# EasyEDA Pro project ProPrj_omb-2024-nano_2026-02-09.epro, schematic Schematic1_2
Board Name: v3-imu-gnss-onboard; Create Date: 2024-06-08; Page Name: P1; Project Name: omb-2024-nano; Schematic Name: Schematic1_2; Update Date: 2024-06-17; Company: EasyEDA.com; Drawn: gauteh; Page Size: A4; Part Number: JLCPCB-002; Reviewed: EasyEDA; Version: V0.1
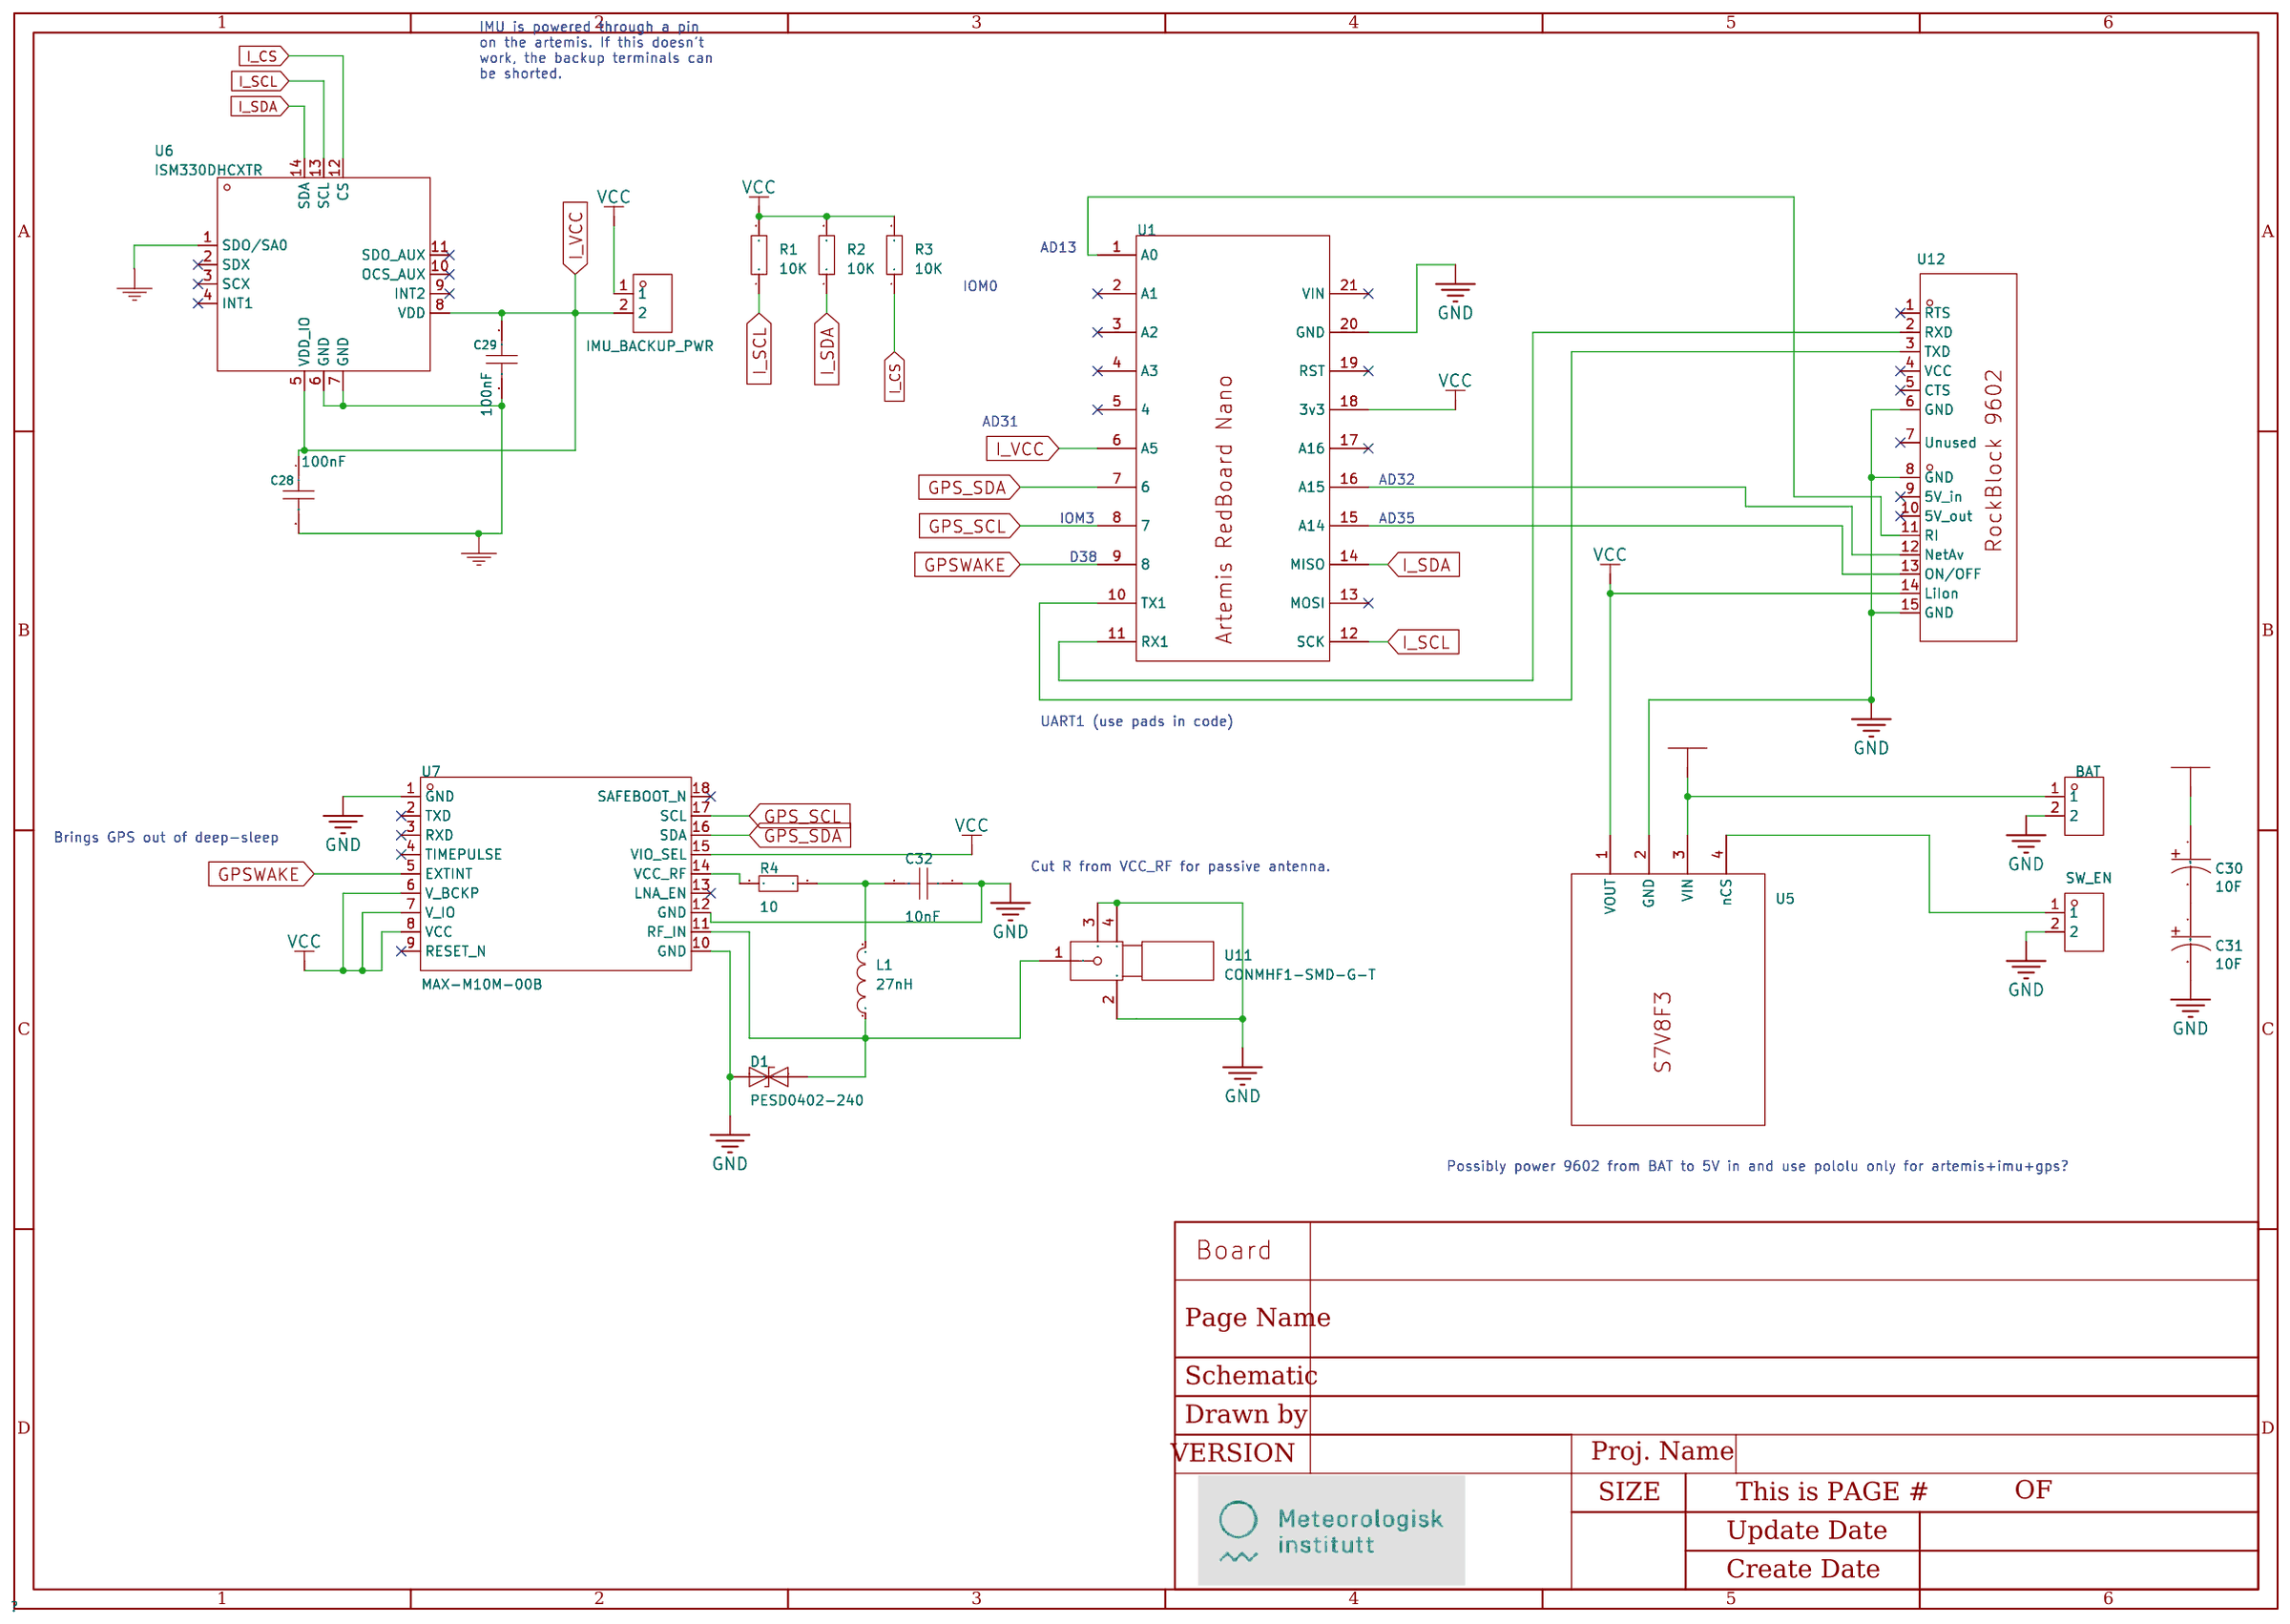
[diagram p2: schematic sheet]

## Parts
BAT1  BAT  [HDR-TH_2P-P2.54-V-M-1]  (no BOM)
C28  100nF  [C0402]
C29  100nF  [C0402]
C30  10F  [CP_12.5X20MM]  (no BOM)
C31  10F  [CP_12.5X20MM]  (no BOM)
C32  10nF  [C0603]
D1  PESD0402-240  [D0402-BI]
IMUBACKUPPWR1  IMU_BACKUP_PWR  [HDR-TH_2P-P2.54-V-M-1]  (no BOM)
L1  27nH  [L0402]
R1  10K  [R0603]
R2  10K  [R0603]
R3  10K  [R0603]
R4  10  [R0603]
SWEN1  SW_EN  [HDR-TH_2P-P2.54-V-M-1]  (no BOM)
U1  -  [ARTEMIS REDBOARD NANO]
U5  -  [HDR-F-2.54_1X4]  (no BOM)
U6  ISM330DHCXTR  [LGA-14_L3.0-W2.5-P0.50-BR]
U7  MAX-M10M-00B  [COMM-SMD_L10.1-W9.7-P1.10_GT-1110F2-AGGB]
U11  CONMHF1-SMD-G-T  [RF-SMD_CONMHF1-SMD-G-T]
U12  -  [HDR-F-2.54_1X15]

## Library data of the parts
BAT1 IMUBACKUPPWR1 SWEN1 = 22284020: Pin Structure:1x2P Pitch:2.54mm Row Spacing:- Circluar Pins/Square Pins:Square Pins Mounting Type:Straight Number of Rows:Plugin Number of Pins:2P Current Rating (Max):- Voltage Rating (Max):- Length of Mating Pin:- Insulation Height:- Contact Material: C; LCSC Part Name: 间距:2.54mm 1x2P 直插 方针; Supplier Part: C234182; Manufacturer: MOLEX; Supplier Footprint: 插件,P=2.54mm; JLCPCB Part Class: Extended Part; Datasheet: https://atta.szlcsc.com/upload/public/pdf/source/20180801/C234182_F77B1C2A9EF8AC9B34CEB7670B45930E.pdf; Supplier: LCSC; Pin Structure: 1x2P; Pitch: 2.54mm; Circluar Pins/Square Pins: Square Pins; Mounting Type: Straight; Number of Rows: Plugin; Number of Pins: 2P; Color: Black
C28 C29 = CC0402KRX7R7BB104: Capacitance: Tolerance:±10% Tolerance:±10% Voltage Rated: Temperature Coefficient:; LCSC Part Name: 100nF ±10% 16V; Supplier Part: C60474; Manufacturer: YAGEO(国巨); Supplier Footprint: 0402; JLCPCB Part Class: Extended Part; Datasheet: https://atta.szlcsc.com/upload/public/pdf/source/20211223/9278FD768280B81DDBEF48FA36411A03.pdf; Supplier: LCSC; Tolerance: ±10%
C30 C31 = 10F: Supplier Part: 581-SCCT20B106PRB; Supplier: Mouser; Manufacturer: AVX; Manufacturer Part: SCCT20B106PRB; Link: https://www.mouser.com/datasheet/2/40/AVX-SCC-1018831.pdf
C32 = CAP_0603: Supplier Footprint: 0603
D1 = PESD0402-240_C1975527: polarity:Bi-Directional Reverse Stand-Off Voltage (Vrwm):24V Maximum Clamping Voltage:40V@Typ Peak Pulse Current (Ipp)@10/1000us:- Peak Pulse Power Dissipation (Ppp)@10/1000us:- Breakdown Voltage:- Type:TVS; LCSC Part Name: TVS 24V截止; Supplier Part: C1975527; Manufacturer: Littelfuse(美国力特); Supplier Footprint: 0402; JLCPCB Part Class: Extended Part; Datasheet: https://atta.szlcsc.com/upload/public/pdf/source/20210701/51AB13F941E3C29FA17D39B567B0F81A.pdf; Supplier: LCSC; polarity: Bi-Directional; Reverse Stand-Off Voltage (Vrwm): 24V; Maximum Clamping Voltage: 40V@Typ; Type: TVS
L1 = LQG15HZ27NH02D: Inductance: Tolerance:±3% Tolerance:±3% Rated Current: Saturation Current (Isat):- DC Resistance (DCR): Q @ Freq:8@100MHz Frequency - Self Resonant: Ratings:AEC-Q200 Type:叠层电感; LCSC Part Name: 27nH ±3%; Supplier Part: C237452; Manufacturer: muRata(村田); Supplier Footprint: 0402; JLCPCB Part Class: Extended Part; Datasheet: https://atta.szlcsc.com/upload/public/pdf/source/20190726/C408154_059E1F516C2F33FE9237CE464B368FAF.pdf; Supplier: LCSC; Tolerance: ±3%; Q @ Freq: 8@100MHz; Ratings: AEC-Q200; Type: 叠层电感
R1-R4 = Res_0603: Supplier Footprint: 0603
U1 = Artemis RedBoard Nano
U5 = S7V8F3
U6 = ISM330DHCXTR: Supplier: LCSC; Supplier Part: C2655101; Manufacturer: ST(意法半导体); JLCPCB Part Class: Extended Part
U7 = MAX-M10M-00B: GNSS Type:Galileo；GLONASS；GNSS；BeiDou；GPS Interface Type:UART；I2C Operating Supply Voltage:1.8V~5.5V Operating Supply Voltage:1.8V~5.5V Sensitivity:-164dBm Sensitivity:-164dBm Operating Temperature:-40℃~+85℃ Operating Temperature:-40℃~+85℃; Supplier Part: C6293820; Manufacturer: U-BLOX; Supplier Footprint: SMD-18P; JLCPCB Part Class: Extended Part; Datasheet: https://atta.szlcsc.com/upload/public/pdf/source/20240419/967224AC3920E85269F3E8F14711A56A.pdf; Supplier: LCSC; GNSS Type: Galileo；GLONASS；GNSS；BeiDou；GPS; Interface Type: UART；I2C; Operating Supply Voltage: 1.8V~5.5V; Sensitivity: -164dBm; Operating Temperature: -40℃~+85℃
U11 = CONMHF1-SMD-G-T: Connector Type:板端 Number of Ports:1 Frequency-Max:6GHz RF Series:IPEX Impedance:50Ω Contact Material:Copper Alloy Contact Plating:Gold Operating Temperature Range:-65℃~+165℃ Operating Temperature Range:-65℃~+165℃; LCSC Part Name: IPEX; Supplier Part: C3174614; Manufacturer: Linx; JLCPCB Part Class: Extended Part; Supplier: LCSC; Connector Type: 板端; Number of Ports: 1; Frequency-Max: 6GHz; RF Series: IPEX; Impedance: 50Ω; Contact Material: Copper Alloy; Contact Plating: Gold; Operating Temperature Range: -65℃~+165℃
U12 = RockBLOCK 9602

## Nets
GND: BAT1.2 C28.2 C29.2 C31.2 C32.1 D1.1(K) SWEN1.2 U1.20(GND) U5.2(GND) U6.1(SDO/SA0) U6.6(GND) U6.7(GND) U7.1(GND) U7.10(GND) U7.12(GND) U11.2 U11.3 U11.4 U12.6(GND) U12.8(GND) U12.15(GND)
VBAT+: BAT1.1 C30.1 U5.3(VIN)
VCC: IMUBACKUPPWR1.1 R1.2 R2.2 R3.2 U1.18(3v3) U5.1(VOUT) U7.6(V_BCKP) U7.7(V_IO) U7.8(VCC) U7.15(VIO_SEL) U12.14(LiIon)
GPS_SCL: U1.8(7) U7.17(SCL)
GPS_SDA: U1.7(6) U7.16(SDA)
GPSWAKE: U1.9(8) U7.5(EXTINT)
I_CS: R3.1 U6.12(CS)
I_SCL: R1.1 U1.12(SCK) U6.13(SCL)
I_SDA: R2.1 U1.14(MISO) U6.14(SDA)
I_VCC: C28.1 C29.1 IMUBACKUPPWR1.2 U1.6(A5) U6.5(VDD_IO) U6.8(VDD)
$1N1205: U1.15(A14) U12.13(ON/OFF)
$1N1212: U1.11(RX1) U12.2(RXD)
$1N1219: U1.10(TX1) U12.3(TXD)
$1N1582: U1.16(A15) U12.12(NetAv)
$1N1610: U1.1(A0) U12.11(RI)
$1N2984: C30.2 C31.1
$1N5235: R4.1 U7.14(VCC_RF)
$1N5486: D1.2(A) L1.1 U7.11(RF_IN) U11.1
$1N5497: C32.2 L1.2 R4.2
Net-(SWEN1-1): SWEN1.1 U5.4(nCS)

Not connected (* = marked no-connect by the designer): U1 2(A1)* 3(A2)* 4(A3)* 5(4)* 13(MOSI)* 17(A16)* 19(RST)* 21(VIN)*; U6 2(SDX)* 3(SCX)* 4(INT1)* 9(INT2)* 10(OCS_AUX)* 11(SDO_AUX)*; U7 2(TXD)* 3(RXD)* 4(TIMEPULSE)* 9(RESET_N)* 13(LNA_EN)* 18(SAFEBOOT_N)*; U12 1(RTS)* 4(VCC)* 5(CTS)* 7(Unused)* 9(5V in)* 10(5V out)*

## Notes on the sheet
- IMU is powered through a pin
  on the artemis. If this doesn't
  work, the backup terminals can
  be shorted.
- AD13
- IOM0
- AD31
- AD32
- IOM3
- AD35
- D38
- UART1 (use pads in code)
- Brings GPS out of deep-sleep
- Cut R from VCC_RF for passive antenna.
- Possibly power 9602 from BAT to 5V in and use pololu only for artemis+imu+gps?
